# Altium schematic sheet Overview.SchDoc
size A3; SheetNumber: 1; SheetTotal: 7
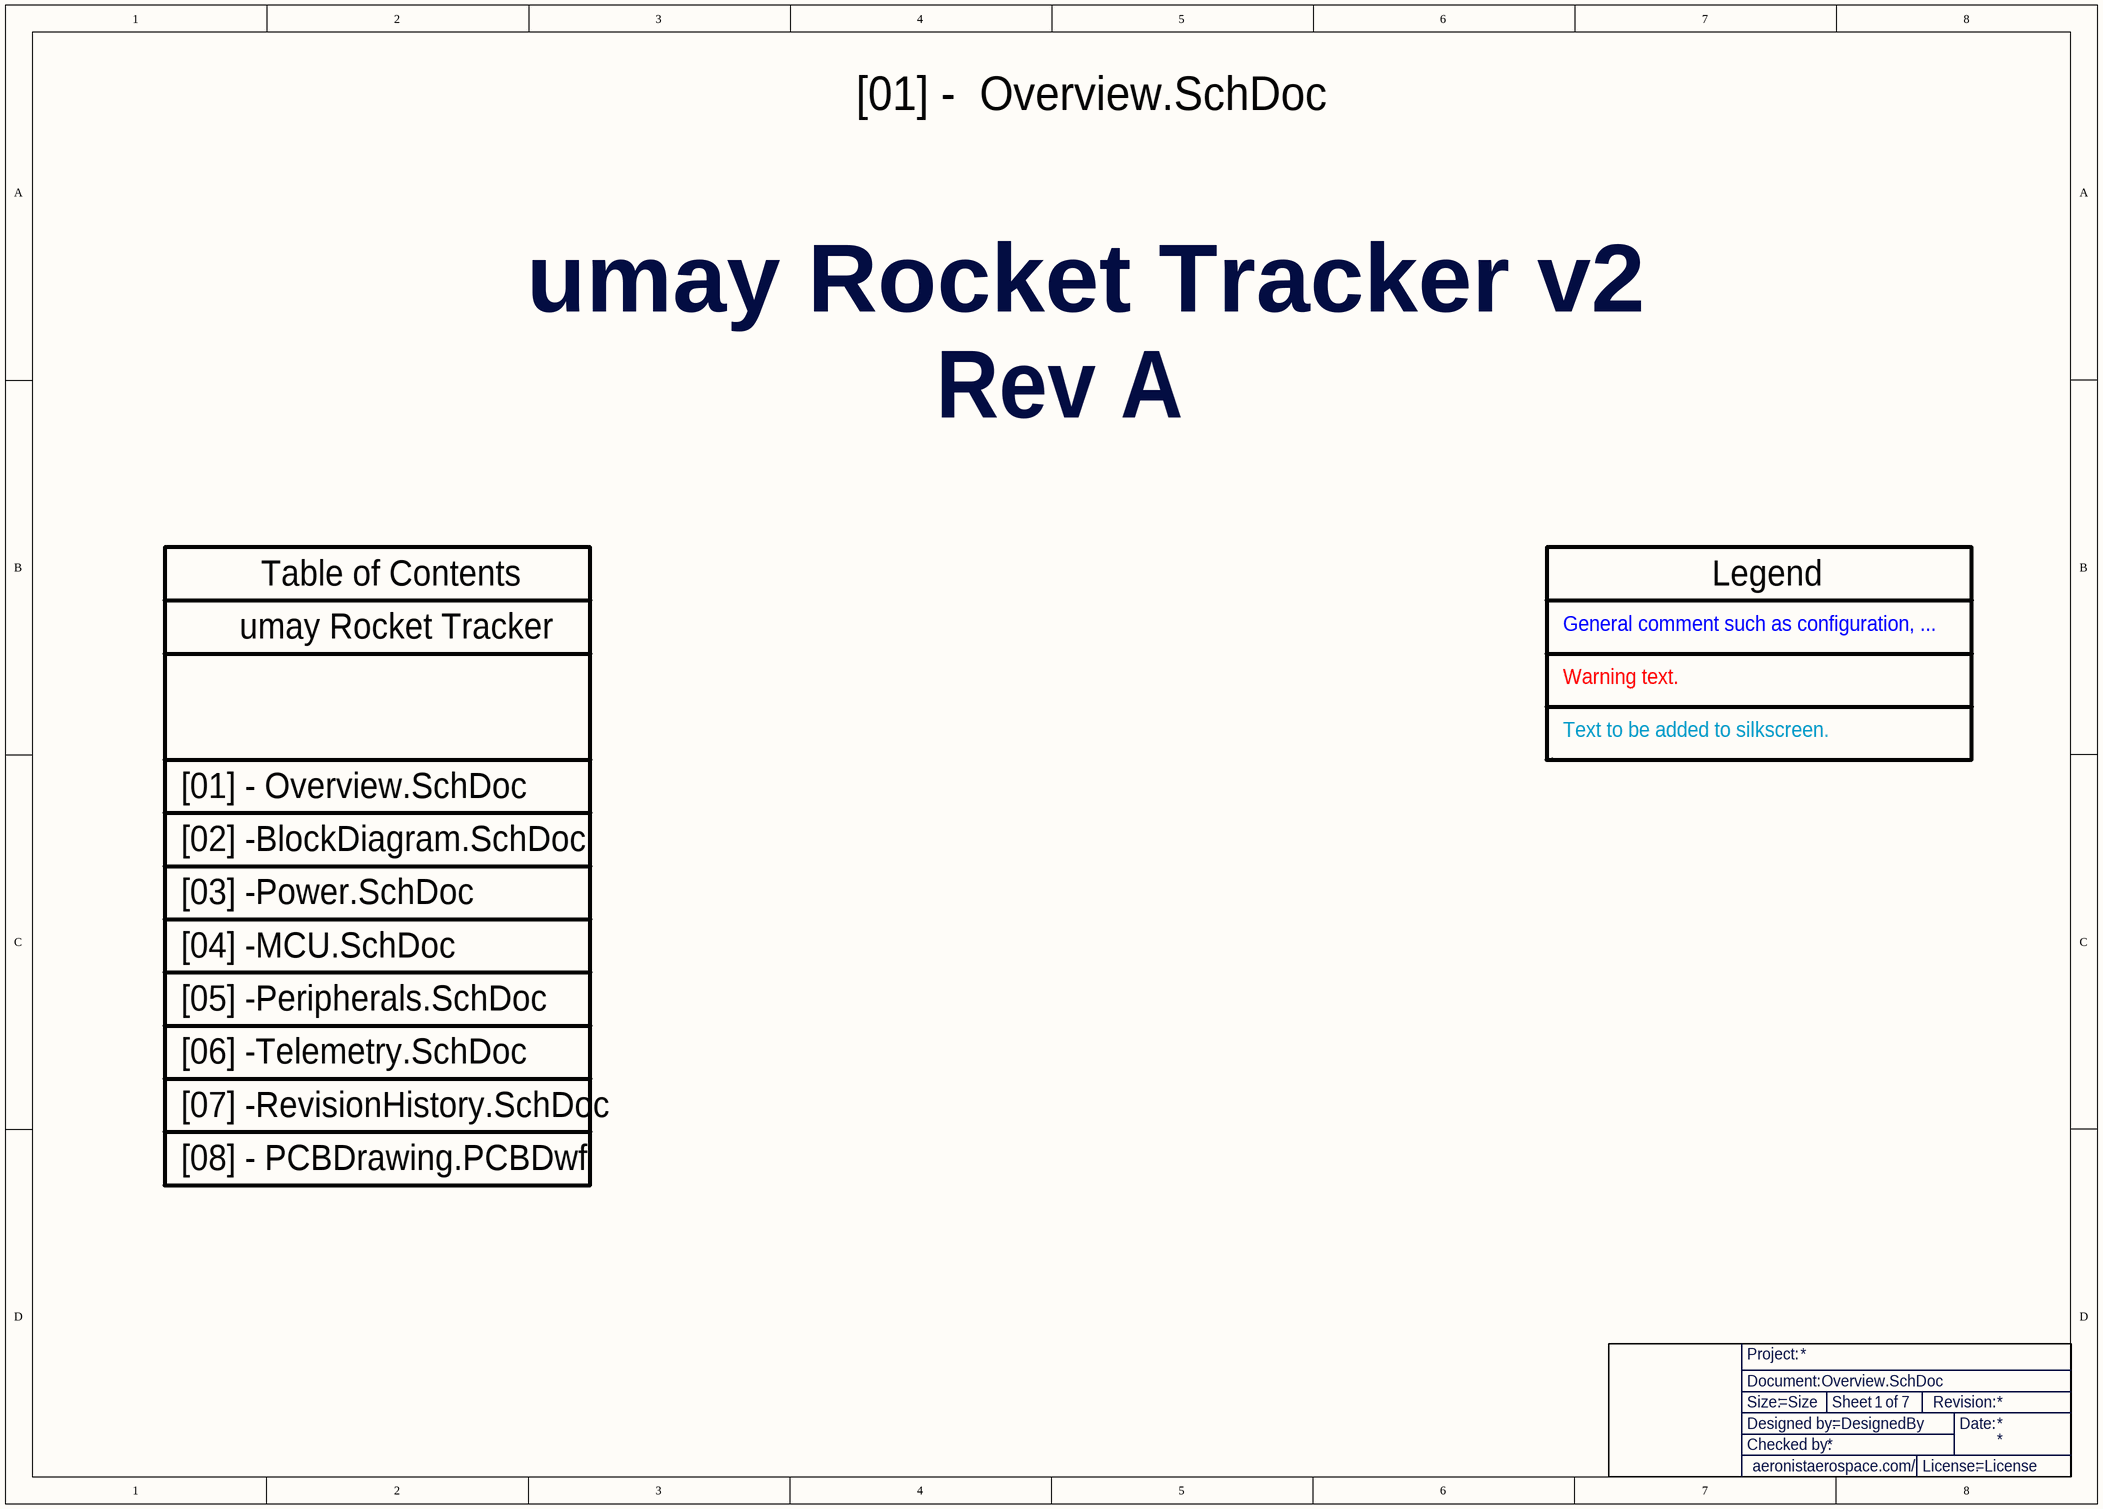
[diagram p0: Overview.SchDoc]

## Parts
?  Title Block  (value not drawn)  (graphical)

## Sub-sheets
Designator = BlockDiagram.SchDoc: no entries
Designator = RevisionHistory.SchDoc: no entries
MCU = MCU.SchDoc: no entries
Peripherals = Peripherals.SchDoc: no entries
Power = Power.SchDoc: no entries
Telemetry = Telemetry.SchDoc: no entries

## Notes on the sheet
- [01] -  Overview.SchDoc
- umay Rocket Tracker v2
- Rev A
- umay Rocket Tracker
- Table of Contents
- General comment such as configuration, ...
- Legend
- Warning text.
- Text to be added to silkscreen.
- [01] - Overview.SchDoc
- [02] -
- [03] -
- [04] -
- [05] -
- [06] -
- [07] -
- [08] - PCBDrawing.PCBDwf
- (in symbol Title Block) Project:; Document:; Size:; Sheet; of; Revision:; Designed by:; Date:; Checked by:; aeronistaerospace.com/; License: